# Altium schematic sheet DCDC_Conv_Section.SchDoc
size A4; DocumentNumber: 5; SheetNumber: 5; SheetTotal: 8
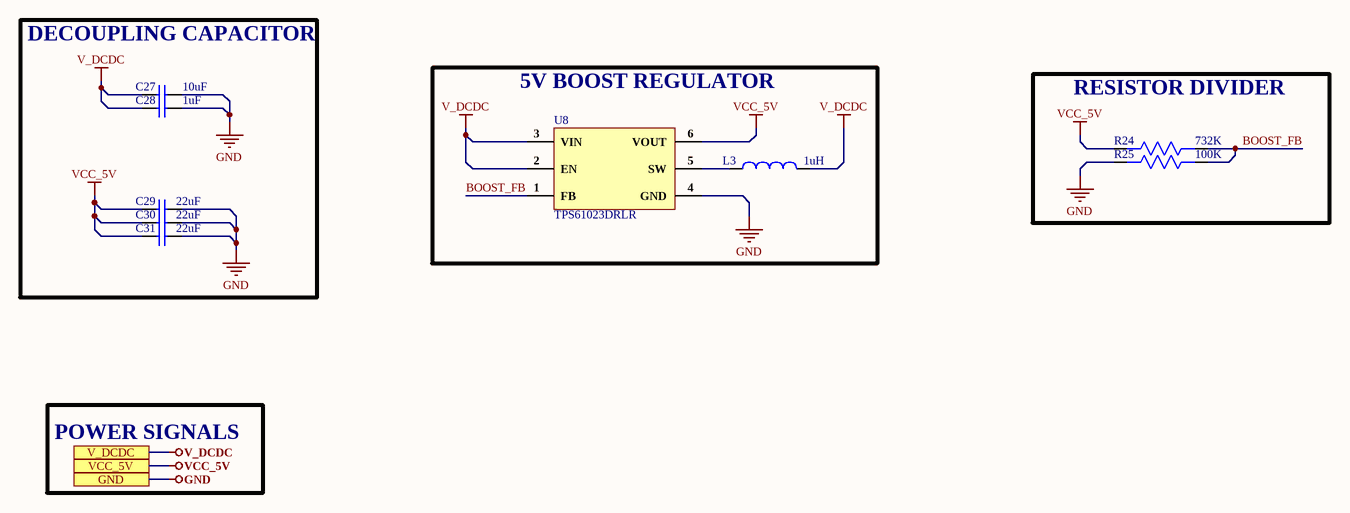
[diagram p0: DCDC_Conv_Section.SchDoc]

## Parts
C27  10uF  [Cap0603]
C28  1uF  [Cap0603]
C29  22uF  [Cap0805]
C30  22uF  [Cap0805]
C31  22uF  [Cap0805]
L3  1uH  [1239AS-H-1R0M=P2]
R24  732K  [Res0603]
R25  100K  [Res0603]
U8  TPS61023DRLR  [TPS61023DRLR]

## Blocks framed on the sheet
DECOUPLING CAPACITOR: C27-C31
5V BOOST REGULATOR: L3 U8
RESISTOR DIVIDER: R24 R25

## Ports
GND, V_DCDC, VCC_5V

## Nets
GND: C27.2 C28.2 C29.2 C30.2 C31.2 R25.2 U8.4(GND) ; port GND
V_DCDC: C27.1 C28.1 L3.2 U8.2(EN) U8.3(VIN) ; port V_DCDC
VCC_5V: C29.1 C30.1 C31.1 R24.2 U8.6(VOUT) ; port VCC_5V
BOOST_FB: R24.1 R25.1 U8.1(FB)
NetL3_1: L3.1 U8.5(SW)

## Notes on the sheet
- POWER SIGNALS

## Library data of the parts
C27 = CC0603MRX5R8BB106: CAP CER 10UF 25V X5R 0603; Manufacturer: Yageo; Tolerance: 20%; ComponentLink1URL: http://www.yageo.com/documents/recent/UPY-GPHC_Y5V_6.3V-to-50V_8.pdf?src-supplier=Digi-Key; ComponentLink1Description: http://www.yageo.com/documents/recent/UPY-GPHC_Y5V_6.3V-to-50V_8.pdf?src-supplier=Digi-Key; ComponentLink2URL: http://www.yageo.com/documents/recent/UPY-GPHC_Y5V_6.3V-to-50V_5.pdf?src-supplier=Avnet+Europe; ComponentLink2Description: http://www.yageo.com/documents/recent/UPY-GPHC_Y5V_6.3V-to-50V_5.pdf?src-supplier=Avnet+Europe; ComponentLink3URL: https://www.verical.com/server-webapp/html/getDatasheet?partID=403611&src-supplier=Verical; ComponentLink3Description: https://www.verical.com/server-webapp/html/getDatasheet?partID=403611&src-supplier=Verical; ComponentLink4URL: http://www.mouser.com/ds/2/447/Yageo_UPY-GP_NP0_16V-to-50V_9-358835.pdf?src-supplier=Mouser; ComponentLink4Description: http://www.mouser.com/ds/2/447/Yageo_UPY-GP_NP0_16V-to-50V_9-358835.pdf?src-supplier=Mouser; ComponentLink5URL: http://www.farnell.com/datasheets/1132289.pdf?src-supplier=Element14; ComponentLink5Description: http://www.farnell.com/datasheets/1132289.pdf?src-supplier=Element14; Supplier 1: Digi-Key; Manufacturer Part Number: CC0603MRX5R8BB106; Stock 1: 0; Pricing 1: 1=0.77, 10=0.568, 50=0.4542, 100=0.3893, 500=0.3082, 1000=0.2595 (USD); Mount: Surface Mount; Case/Package: 0603; Case Code (Imperial): 0603; Case Code (Metric): 1608; Min Operating Temperature: -55°C; Max Operating Temperature: 85°C; Packaging: Cut Tape; Capacitance: 10uF; Voltage Rating: 25V; RoHS Compliant: Yes; ComponentLink6URL: https://www.yageo.com/upload/media/product/productsearch/datasheet/mlcc/UPY-GPHC_X5R_4V-to-50V_26.pdf?src-supplier=Digi-Key; ComponentLink6Description: https://www.yageo.com/upload/media/product/productsearch/datasheet/mlcc/UPY-GPHC_X5R_4V-to-50V_26.pdf?src-supplier=Digi-Key; Supplier Part Number 1: 311-3494-6-ND
C28 = CC0603ZRY5V8BB105: CAP CER 1UF 25V Y5V 0603; Manufacturer: Yageo; Tolerance: 80%; ComponentLink1URL: http://www.yageo.com/documents/recent/UPY-GPHC_Y5V_6.3V-to-50V_8.pdf?src-supplier=Digi-Key; ComponentLink1Description: http://www.yageo.com/documents/recent/UPY-GPHC_Y5V_6.3V-to-50V_8.pdf?src-supplier=Digi-Key; ComponentLink2URL: http://www.yageo.com/documents/recent/UPY-GPHC_Y5V_6.3V-to-50V_5.pdf?src-supplier=Avnet+Europe; ComponentLink2Description: http://www.yageo.com/documents/recent/UPY-GPHC_Y5V_6.3V-to-50V_5.pdf?src-supplier=Avnet+Europe; ComponentLink3URL: https://www.verical.com/server-webapp/html/getDatasheet?partID=403611&src-supplier=Verical; ComponentLink3Description: https://www.verical.com/server-webapp/html/getDatasheet?partID=403611&src-supplier=Verical; ComponentLink4URL: http://www.mouser.com/ds/2/447/Yageo_UPY-GP_NP0_16V-to-50V_9-358835.pdf?src-supplier=Mouser; ComponentLink4Description: http://www.mouser.com/ds/2/447/Yageo_UPY-GP_NP0_16V-to-50V_9-358835.pdf?src-supplier=Mouser; ComponentLink5URL: http://www.farnell.com/datasheets/1132289.pdf?src-supplier=Element14; ComponentLink5Description: http://www.farnell.com/datasheets/1132289.pdf?src-supplier=Element14; Supplier 1: Digi-Key; Manufacturer Part Number: CC0603ZRY5V8BB105; Stock 1: 82432; Pricing 1: 1=0.13, 10=0.096, 50=0.0544, 100=0.045, 500=0.0316, 1000=0.0261 (USD); Mount: Surface Mount; Case/Package: 0603; Case Code (Imperial): 0603; Case Code (Metric): 1608; Min Operating Temperature: -30°C; Max Operating Temperature: 85°C; Voltage Rating (DC): 25V; Packaging: Tape and Reel; Capacitance: 1uF; Voltage Rating: 25V; Dielectric: Y5V; Termination: SMD/SMT; Resistor Type: Ceramic; Series: CC; Length: 0.063inch; Width: 0.031inch; Height: 0.8mm; Thickness: 0.035inch; Lead Free: Lead Free; Halogen Free: Halogen Free; RoHS Compliant: Yes; Supplier Part Number 1: 311-1829-1-ND
C29-C31 = C2012X5R1V226MT000E: CAP CER 22UF 35V X5R 0805
L3 = 1239AS-H-1R0M=P2: 3A 1uH ±20% 59mΩ 1008 Inductors (SMD) ROHS
R24 = AC0603FR-07732KL: RES SMD 732kOhm 1% 0603; Manufacturer: Yageo; Power Rating: 100mW; Resistance: 732kR; Voltage Rating: 50V; Temperature Coefficient: 100ppm/°C; Supplier 1: Mouser; Manufacturer Part Number: AC0603FR-07732KL; RoHS: Yes; Category: Chip SMD Resistors; Stock 1: 40000; Pricing 1: 1=0.10000, 10=0.02200, 50=0.02200, 100=0.00800, 1000=0.00600, 10000=0.00400 (USD); Case/Package: 0603; Case Code (Imperial): 0603; Case Code (Metric): 1608; Min Operating Temperature: -55°C; Max Operating Temperature: 155°C; Packaging: Tape and Reel; Tolerance: 1%; Resistor Type: Thick Film; Number of Terminations: 2; Termination: SMD/SMT; Max Power Dissipation: 100mW; Features: Moisture Resistant,Automotive AEC-Q200; Series: AC; Length: 0.063inch; Width: 0.031inch; Height: 0.022inch; RoHS Compliant: Yes; ComponentLink1URL: http://www.mouser.com/ds/2/447/yageodocoutput-1111992.pdf?src-supplier=Mouser; ComponentLink1Description: http://www.mouser.com/ds/2/447/yageodocoutput-1111992.pdf?src-supplier=Mouser; ComponentLink2URL: http://www.yageo.com/NewPortal/yageodocoutput?fileName=/pdf/R-Chip/PYu-AC_51_RoHS_L_6.pdf&src-supplier=Digi-Key; ComponentLink2Description: http://www.yageo.com/NewPortal/yageodocoutput?fileName=/pdf/R-Chip/PYu-AC_51_RoHS_L_6.pdf&src-supplier=Digi-Key; Supplier Part Number 1: 603-AC0603FR-07732KL
R25 = RC0603FR-07100KL: RES SMD 100K OHM 1% 1/10W 0603
U8 = TPS61023DRLR: 3.7-A boost converter with 0.5-V ultra-low input voltage 6-SOT-5X3 -40 to 125; Manufacturer: Texas Instruments; Supplier 1: Digi-Key; Manufacturer Part Number: TPS61023DRLR; RoHS: Yes; Category: Voltage Regulators - Switching; Pricing 1: 1=1.03000, 10=0.91900, 25=0.87240, 100=0.71680, 250=0.67004, 500=0.59212, 1000=0.51450 (USD); Supplier Part Number 1: 296-TPS61023DRLRDKR-ND